# Altium schematic sheet Sensors-Sheet.SchDoc
size A4; SheetNumber: 3; SheetTotal: 3
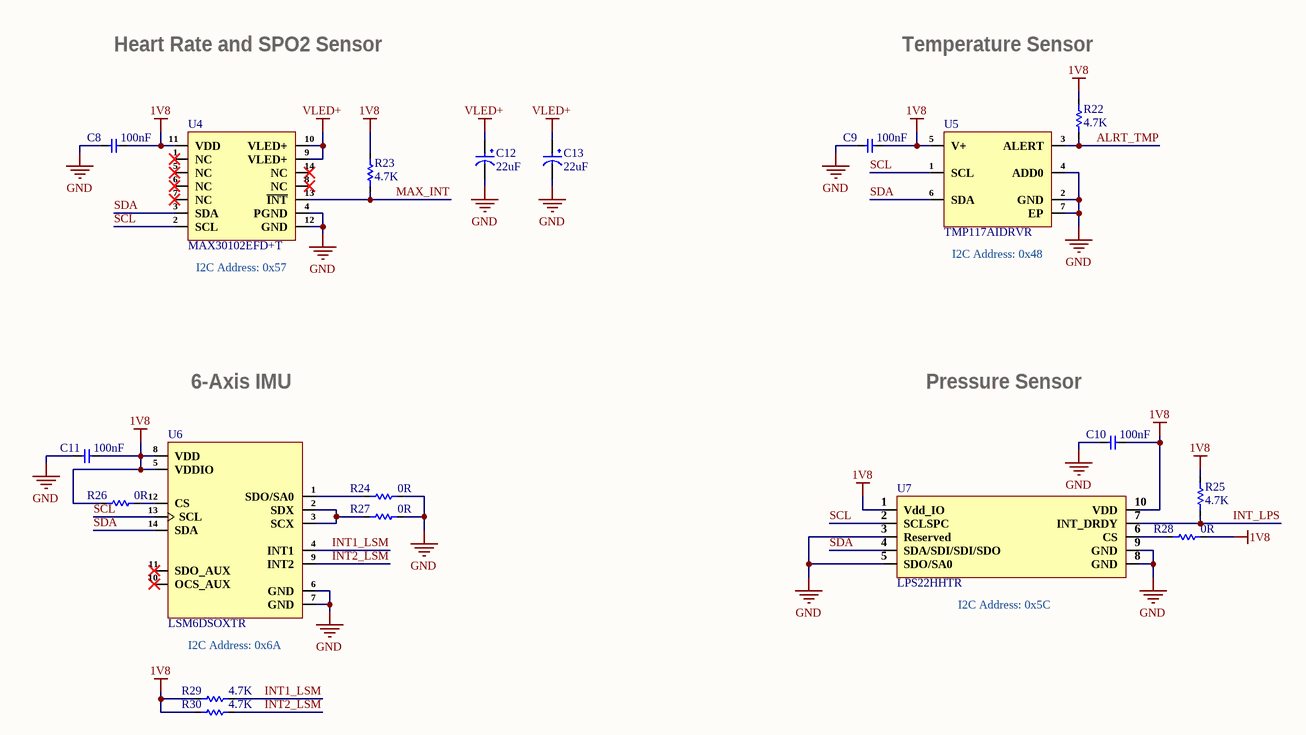
[diagram p0: Sensors-Sheet.SchDoc]

## Parts
C8  100nF  [CAP-0201]
C9  100nF  [CAP-0201]
C10  100nF  [CAP-0201]
C11  100nF  [CAP-0201]
C12  22uF  [Tant-0603]
C13  22uF  [Tant-0603]
R22  4.7K  [Res-0201]
R23  4.7K  [Res-0201]
R24  0R  [Res-0201]
R25  4.7K  [Res-0201]
R26  0R  [Res-0201]
R27  0R  [Res-0201]
R28  0R  [Res-0201]
R29  4.7K  [Res-0201]
R30  4.7K  [Res-0201]
U4  MAX30102EFD+T  [MAX30102EFD+T]
U5  TMP117AIDRVR  [WDFN-6-EP(2x2)]
U6  LSM6DSOXTR  [14-LGA (2.5x3)]
U7  LPS22HHTR  [HLGA-10(2x2)]

## Nets
1V8: C8.1 C9.1 C10.1 C11.1 R22.2 R23.2 R25.2 R26.1 R28.2 R29.2 R30.2 U4.11(VDD) U5.5(V+) U6.5(VDDIO) U6.8(VDD) U7.1(Vdd_IO) U7.10(VDD)
GND: C8.2 C9.2 C10.2 C11.2 C12.2 C13.2 R24.2 R27.2 U4.4(PGND) U4.12(GND) U5.2(GND) U5.4(ADD0) U5.7(EP) U6.6(GND) U6.7(GND) U7.3(Reserved) U7.5(SDO/SA0) U7.8(GND) U7.9(GND)
VLED+: C12.1 C13.1 U4.9(VLED+) U4.10(VLED+)
ALRT_TMP: R22.1 U5.3(ALERT)
INT1_LSM: R29.1 U6.4(INT1)
INT2_LSM: R30.1 U6.9(INT2)
INT_LPS: R25.1 U7.7(INT_DRDY)
MAX_INT: R23.1 U4.13(~{INT})
SCL: U4.2(SCL) U5.1(SCL) U6.13(SCL) U7.2(SCLSPC)
SDA: U4.3(SDA) U5.6(SDA) U6.14(SDA) U7.4(SDA/SDI/SDI/SDO)
NetR24_1: R24.1 U6.1(SDO/SA0)
NetR26_2: R26.2 U6.12(CS)
NetR27_1: R27.1 U6.2(SDX) U6.3(SCX)
NetR28_1: R28.1 U7.6(CS)

Not connected (* = marked no-connect by the designer): U4 1(NC)* 5(NC)* 6(NC)* 7(NC)* 8(NC)* 14(NC)*; U6 10(OCS_AUX)* 11(SDO_AUX)*

## Notes on the sheet
- Heart Rate and SPO2 Sensor
- (near R22) Temperature Sensor
- (near U4) I2C Address: 0x57
- (near U5) I2C Address: 0x48
- 6-Axis IMU
- (near C10) Pressure Sensor
- (near U7) I2C Address: 0x5C
- I2C Address: 0x6A
- File:
- Title:
- Date:
- Page
- Num:
- Total:
- Drawn By: Huzaifa Ali

## Library data of the parts
C8-C11 = CC0201KRX5R6BB104: CAP CER 0.1UF 10V X5R 0201; Manufacturer: Yageo; Tolerance: 10%; Supplier 1: Mouser; Manufacturer Part Number: CC0201KRX5R6BB104; RoHS: Yes; Category: Ceramic Capacitors; Stock 1: 824403; Pricing 1: 1=0.10000, 10=0.02400, 50=0.02400, 100=0.01900, 1000=0.01100, 10000=0.00900 (USD); Mount: Surface Mount; Case/Package: 0201; Case Code (Imperial): 0201; Case Code (Metric): 0603; Weight: 6E-06oz; Min Operating Temperature: -55°C; Max Operating Temperature: 85°C; Capacitance: 100nF; Dielectric: X5R; Voltage Rating (DC): 10V; Packaging: Tape and Reel; Termination: SMD/SMT; Resistor Type: Ceramic; Voltage Rating: 10V; Series: CC; Construction: Flat; Length: 0.6mm; Width: 0.012inch; Height: 0.3mm; Thickness: 0.013inch; Depth: 0.3mm; Radiation Hardening: No; Lead Free: Lead Free; Halogen Free: Halogen Free; RoHS Compliant: Yes; ComponentLink1URL: https://datasheet.ciiva.com/11587/upy-gphc-x5r-4v-to-50v-12-11587190.pdf?src-supplier=Avnet; ComponentLink1Description: https://datasheet.ciiva.com/11587/upy-gphc-x5r-4v-to-50v-12-11587190.pdf?src-supplier=Avnet; Supplier Part Number 1: 603-CC201KRX5R6BB104; LCSC Part Number: C190183
C12 C13 = T58MM226M6R3C0500: CAP TANT POLY 22UF 6.3V 0603; Manufacturer: Vishay; Item Type: Capacitor; Supplier: Mouser; Supplier Part Number: 74-T58MM226M6R3C0500; Manufacturer Part Number: T58MM226M6R3C0500; RoHS: Yes; Category: Tantalum Capacitors; Stock: 4661; Pricing: 1=0.71, 10=0.379, 50=0.379, 100=0.313, 1000=0.208, 10000=0.168 (USD); ComponentLink1URL: http://www.farnell.com/datasheets/2617265.pdf?src-supplier=Farnell; ComponentLink1Description: http://www.farnell.com/datasheets/2617265.pdf?src-supplier=Farnell; ComponentLink2URL: https://datasheet.octopart.com/T58MM226M6R3C0500-Vishay-datasheet-78835337.pdf?src-supplier=Element14; ComponentLink2Description: https://datasheet.octopart.com/T58MM226M6R3C0500-Vishay-datasheet-78835337.pdf?src-supplier=Element14; ComponentLink3URL: https://datasheet.octopart.com/T58MM226M6R3C0500.-Vishay-datasheet-159617154.pdf?src-supplier=Newark; ComponentLink3Description: https://datasheet.octopart.com/T58MM226M6R3C0500.-Vishay-datasheet-159617154.pdf?src-supplier=Newark; ComponentLink4URL: http://www.farnell.com/datasheets/2617265.pdf?src-supplier=Newark; ComponentLink4Description: http://www.farnell.com/datasheets/2617265.pdf?src-supplier=Newark; ComponentLink5URL: http://www.vishay.com/docs/40189/t58.pdf?src-supplier=Avnet; ComponentLink5Description: http://www.vishay.com/docs/40189/t58.pdf?src-supplier=Avnet; ComponentLink6URL: https://datasheet.octopart.com/T58MM226M6R3C0500-Vishay-datasheet-95510002.pdf?src-supplier=Future+Electronics; ComponentLink6Description: https://datasheet.octopart.com/T58MM226M6R3C0500-Vishay-datasheet-95510002.pdf?src-supplier=Future+Electronics; ComponentLink7URL: https://www.vishay.com/docs/40189/t58.pdf?src-supplier=Digi-Key; ComponentLink7Description: https://www.vishay.com/docs/40189/t58.pdf?src-supplier=Digi-Key; Package: 0603; LCSC Part Number: C2158410; ComponentLink8Description: LCSC; ComponentLink8URL: https://www.lcsc.com/product-detail/Tantalum-Capacitors_Vishay-Intertech-T58MM226M6R3C0500_C2158410.html
R22 R23 R25 R29 R30 = RC0201FR-074K7L: RES 4.7K OHM 1% 1/20W 0201; Manufacturer: Yageo; Item Type: Resistor; Supplier: Future Electronics; Supplier Part Number: 7537285; Manufacturer Part Number: RC0201FR-074K7L; RoHS: Yes; Category: Chip SMD Resistors; Stock: 1610000; Pricing: 10000=0.0014, 50000=0.0013, 250000=0.0013, 750000=0.0012, 2000000=0.0011 (USD); ComponentLink1URL: https://datasheet.ciiva.com/2493/pyu-r-int-thick-7-2493811.pdf?src-supplier=Digi-Key; ComponentLink1Description: https://datasheet.ciiva.com/2493/pyu-r-int-thick-7-2493811.pdf?src-supplier=Digi-Key; ComponentLink2URL: https://datasheet.ciiva.com/2493/pyu-r-int-thick-7-2493812.pdf?src-supplier=Digi-Key; ComponentLink2Description: https://datasheet.ciiva.com/2493/pyu-r-int-thick-7-2493812.pdf?src-supplier=Digi-Key; ComponentLink3URL: https://datasheet.ciiva.com/2493/pyu-r-int-thick-7-2493813.pdf?src-supplier=Digi-Key; ComponentLink3Description: https://datasheet.ciiva.com/2493/pyu-r-int-thick-7-2493813.pdf?src-supplier=Digi-Key; ComponentLink4URL: https://datasheet.ciiva.com/8892/pyu-rc0201-51-rohs-l-8-8892942.pdf?src-supplier=Avnet; ComponentLink4Description: https://datasheet.ciiva.com/8892/pyu-rc0201-51-rohs-l-8-8892942.pdf?src-supplier=Avnet; ComponentLink5URL: https://datasheet.ciiva.com/7672/1563626-7672233.pdf?src-supplier=Element14; ComponentLink5Description: https://datasheet.ciiva.com/7672/1563626-7672233.pdf?src-supplier=Element14; LCSC Part Number: C138135
R24 R26-R28 = RC0201JR-070RL: RES SMD 0 OHM JUMPER 1/20W 0201; Manufacturer: Yageo; Power Rating: 50mW; Tolerance: 5%; Voltage Rating: 25V; Supplier 1: Digi-Key; Manufacturer Part Number: RC0201JR-070RL; RoHS: Yes; Category: Chip SMD Resistors; Stock 1: 11079; Pricing 1: 1=0.10000, 10=0.03600, 25=0.02640, 50=0.02000, 100=0.01480, 250=0.01128, 500=0.00904, 1000=0.00665, 5000=0.00477 (USD); Case/Package: 0201; Contact Plating: Tin,Matte; Case Code (Metric): 0603; Case Code (Imperial): 0201; Weight: 6E-06oz; Size Code: 0201; Min Operating Temperature: -55°C; Max Operating Temperature: 125°C; Resistor Type: Thick Film; Resistance: 0R; Packaging: Tape and Reel; Package Quantity: 10000; Number of Terminations: 2; Termination: SMD/SMT; Max Power Dissipation: 50mW; Voltage Rating (DC): 25V; Features: Moisture Resistant; Series: RC; Construction: Rectangular; Resistance Tolerance: 5%; Length: 0.6mm; Width: 0.012inch; Height: 0.01inch; Depth: 0.3mm; Radiation Hardening: No; RoHS Compliant: Yes; REACH SVHC: Unknown; Military Standard: Not; Lead Free: Lead Free; ComponentLink1URL: https://datasheet.ciiva.com/7672/1563626-7672247.pdf?src-supplier=Element14; ComponentLink1Description: https://datasheet.ciiva.com/7672/1563626-7672247.pdf?src-supplier=Element14; ComponentLink2URL: https://datasheet.ciiva.com/7660/1421516-7660808.pdf?src-supplier=Element14; ComponentLink2Description: https://datasheet.ciiva.com/7660/1421516-7660808.pdf?src-supplier=Element14; ComponentLink3URL: https://datasheet.ciiva.com/7672/1563626-7672248.pdf?src-supplier=Element14; ComponentLink3Description: https://datasheet.ciiva.com/7672/1563626-7672248.pdf?src-supplier=Element14; ComponentLink4URL: https://datasheet.ciiva.com/16855/pyu-rc0201-51-rohs-l-8-16855994.pdf?src-supplier=Avnet+Europe; ComponentLink4Description: https://datasheet.ciiva.com/16855/pyu-rc0201-51-rohs-l-8-16855994.pdf?src-supplier=Avnet+Europe; ComponentLink5URL: https://datasheet.ciiva.com/28419/pyu-rc0201-51-rohs-l-8-28419660.pdf?src-supplier=Avnet+Europe; ComponentLink5Description: https://datasheet.ciiva.com/28419/pyu-rc0201-51-rohs-l-8-28419660.pdf?src-supplier=Avnet+Europe; ComponentLink6URL: https://datasheet.ciiva.com/46391/1421516-46391340.pdf?src-supplier=Element14; ComponentLink6Description: https://datasheet.ciiva.com/46391/1421516-46391340.pdf?src-supplier=Element14; ComponentLink7URL: https://datasheet.ciiva.com/8896/pyu-rc0201-51-rohs-l-8-8896143.pdf?src-supplier=Avnet; ComponentLink7Description: https://datasheet.ciiva.com/8896/pyu-rc0201-51-rohs-l-8-8896143.pdf?src-supplier=Avnet; Supplier Part Number 1: 311-0.0NCT-ND; LCSC Part Number: C106228
U4 = MAX30102EFD+T: SENSOR OXIMETER/HEART RATE I2C; Manufacturer: Maxim; Item Type: Heart Rate Sensor; Supplier: Mouser; Supplier Part Number: 700-MAX30102EFD+T; Manufacturer Part Number: MAX30102EFD+T; RoHS: Yes; Category: Sensors; Stock: 7965; Pricing: 1=12.43, 10=9.84, 50=9.32, 100=7.95, 1000=7.05, 10000=6.66 (USD); Min Operating Temperature: -40°C; Max Operating Temperature: 85°C; Output Type: I2C; Series: -; Packaging: Cut Tape; RoHS Compliant: Yes; ComponentLink1URL: https://datasheets.maximintegrated.com/en/ds/MAX30102.pdf?src-supplier=Digi-Key; ComponentLink1Description: https://datasheets.maximintegrated.com/en/ds/MAX30102.pdf?src-supplier=Digi-Key; LCSC Part Number: C6454833
U5 = TMP117AIDRVR: Temperature Sensor Digital, Local -55°C ~ 150°C 16 b 6-WSON (2x2); Manufacturer: Texas Instruments; Item Type: IC; Interface: 39,4268,4478Interface; Max Supply Voltage: 5.5V; Min Supply Voltage: 1.8V; Supplier: Mouser; LCSC Part Number: C699536; Manufacturer Part Number: TMP117AIDRVR; RoHS: Yes; Stock: 14370; Pricing: 1=4.53, 10=3.95, 50=3.64, 100=3.52, 1000=3.27, 10000=3.04 (USD); Pins: 6NUMBER; Length: 2mm; Width: 2mm; Height: 800um; Thickness: 750um; ComponentLink1URL: http://www.ti.com/lit/gpn/tmp117?src-supplier=Digikey; ComponentLink1Description: http://www.ti.com/lit/gpn/tmp117?src-supplier=Digikey; ComponentLink2URL: http://www.ti.com/lit/ds/symlink/tmp117.pdf?src-supplier=Digikey; ComponentLink2Description: http://www.ti.com/lit/ds/symlink/tmp117.pdf?src-supplier=Digikey
U6 = LSM6DSOXTR: INEMO INERTIAL MODULE: 3D ACCELE; Manufacturer: STMicroelectronics; Item Type: IC; Sensor Type: Accelerometer,Gyroscope,6 Axis; Output Type: SPI,I2C; Max Supply Voltage: 3.6V; Min Supply Voltage: 1.62V; Operating Supply Current: 550uA; Operating Supply Voltage: 1.8V; Supplier: Mouser; LCSC Part Number: C481766; Manufacturer Part Number: LSM6DSOXTR; RoHS: Yes; Stock: 1151; Pricing: 1=4.21, 10=3.61, 50=3.28, 100=3.16, 1000=2.84, 10000=2.64 (USD); Mounting Technology: Surface Mount; Case/Package: LGA; Min Operating Temperature: -40°C; Max Operating Temperature: 85°C; Series: iNEMO; Packaging: Cut Tape; Height: 860um; ComponentLink1URL: http://www.farnell.com/datasheets/2736724.pdf?src-supplier=Farnell; ComponentLink1Description: http://www.farnell.com/datasheets/2736724.pdf?src-supplier=Farnell; ComponentLink2URL: https://www.st.com/resource/en/datasheet/lsm6dsox.pdf?src-supplier=Digikey; ComponentLink2Description: https://www.st.com/resource/en/datasheet/lsm6dsox.pdf?src-supplier=Digikey; ComponentLink3URL: http://www.farnell.com/datasheets/2736724.pdf?src-supplier=Element14; ComponentLink3Description: http://www.farnell.com/datasheets/2736724.pdf?src-supplier=Element14; ComponentLink4URL: http://www.farnell.com/datasheets/2736724.pdf?src-supplier=Newark; ComponentLink4Description: http://www.farnell.com/datasheets/2736724.pdf?src-supplier=Newark
U7 = LPS22HHTR: SENSOR 18.27PSIA 24BIT 10HLGA; Manufacturer: STMicroelectronics; Item Type: Pressure Sensors; Output Type: SPI,I2C; Pressure Type: Absolute; Port Style: No Port; Max Pressure: 290PSI; Max Supply Voltage: 3.7V; Min Supply Voltage: 1.7V; Supplier: Mouser; LCSC Part Number: C2827824; Manufacturer Part Number: LPS22HHTR; RoHS: Yes; Stock: 8715; Pricing: 1=2.49, 10=2, 50=1.91, 100=1.84, 1000=1.63, 10000=1.49 (USD); Case/Package: HLGA; Pins: 10; Min Operating Temperature: -40°C; Max Operating Temperature: 85°C; Termination: SMD/SMT; Series: -; Packaging: Cut Tape; Operating Pressure: 18.27PSI; Height: 800um; RoHS Compliant: Yes; ComponentLink1URL: http://www.farnell.com/datasheets/2710908.pdf?src-supplier=Farnell; ComponentLink1Description: http://www.farnell.com/datasheets/2710908.pdf?src-supplier=Farnell; ComponentLink2URL: http://www.farnell.com/datasheets/2710908.pdf?src-supplier=Newark; ComponentLink2Description: http://www.farnell.com/datasheets/2710908.pdf?src-supplier=Newark; ComponentLink3URL: https://www.st.com/resource/en/datasheet/lps22hh.pdf?src-supplier=Digikey; ComponentLink3Description: https://www.st.com/resource/en/datasheet/lps22hh.pdf?src-supplier=Digikey; ComponentLink4URL: https://www.st.com/resource/en/data_brief/lps22hh.pdf?src-supplier=Digikey; ComponentLink4Description: https://www.st.com/resource/en/data_brief/lps22hh.pdf?src-supplier=Digikey